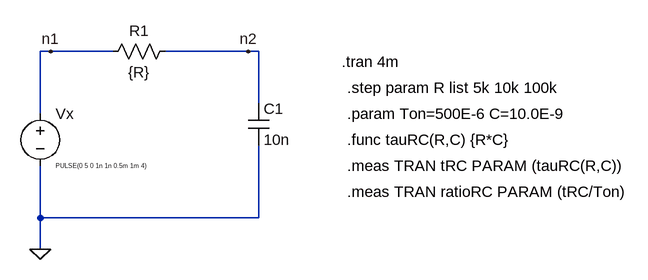
[diagram p0: schematic exp5 A.asc]
exp5 A.asc, the LTspice schematic file:
Version 4
SHEET 1 908 680
WIRE 0 0 -16 0
WIRE 96 0 0 0
WIRE 304 0 176 0
WIRE 320 0 304 0
WIRE 320 80 320 0
WIRE -16 96 -16 0
WIRE -16 256 -16 176
WIRE 320 256 320 144
WIRE 320 256 -16 256
WIRE -16 304 -16 256
FLAG -16 304 0
FLAG 0 0 n1
FLAG 304 0 n2
SYMBOL res 192 -16 R90
WINDOW 0 0 56 VBottom 2
WINDOW 3 32 56 VTop 2
SYMATTR InstName R1
SYMATTR Value {R}
SYMBOL voltage -16 80 R0
WINDOW 3 24 96 Left 0
WINDOW 123 0 0 Left 0
WINDOW 39 0 0 Left 0
SYMATTR InstName Vx
SYMATTR Value PULSE(0 5 0 1n 1n 0.5m 1m 4)
SYMBOL cap 304 80 R0
SYMATTR InstName C1
SYMATTR Value 10n
TEXT 448 16 Left 2 !.tran 4m
TEXT 456 56 Left 2 !.step param R list 5k 10k 100k
TEXT 456 96 Left 2 !.param Ton=500E-6 C=10.0E-9
TEXT 456 136 Left 2 !.func tauRC(R,C) {R*C}
TEXT 456 176 Left 2 !.meas TRAN tRC PARAM (tauRC(R,C))
TEXT 456 216 Left 2 !.meas TRAN ratioRC PARAM (tRC/Ton)

The netlist it stands for:
* exp5 A.asc
R1 n2 n1 {R}
Vx n1 0 PULSE(0 5 0 1n 1n 0.5m 1m 4)
C1 n2 0 10n
.tran 4m
.step param R list 5k 10k 100k
.param Ton=500E-6 C=10.0E-9
.func tauRC(R,C) {R*C}
.meas TRAN tRC PARAM (tauRC(R,C))
.meas TRAN ratioRC PARAM (tRC/Ton)
.backanno
.end